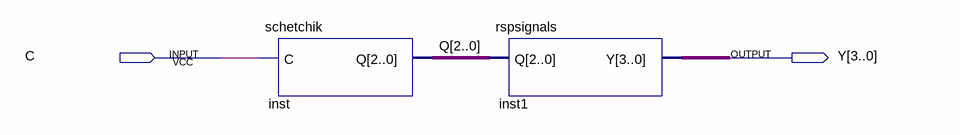
[diagram p0: schematic sheet]
// Quartus schematic lab1.bdf as structural Verilog: 2 symbols, 2 pins
module lab1 (
  input  C,
  output [3:0] Y
);

  wire [2:0] Q;

  schetchik inst (.C(C), .Q(Q));
  rspsignals inst1 (.Q(Q), .Y(Y));
endmodule
